# Altium schematic sheet KeyPad.SchDoc
size A; SheetNumber: 9; SheetTotal: 12
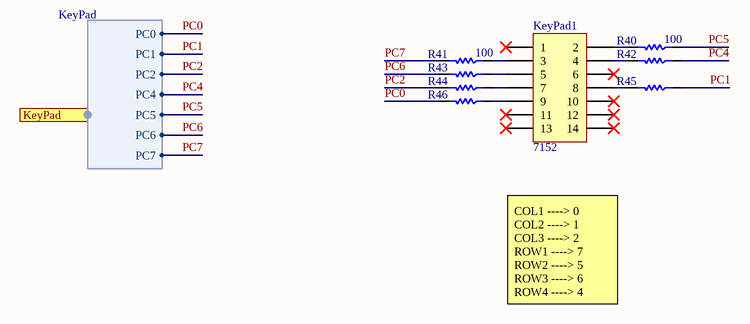
[diagram p0: KeyPad.SchDoc]

## Parts
KeyPad1  Inflow: 7152  [HDR_THT_7x2M_2.54mm]  (hidden comment: 7x2)
R40  100  [RES 1206 (3216X08L)]
R41  100  [RES 1206 (3216X08L)]
R42  (no value)  [RES 1206 (3216X08L)]
R43  (no value)  [RES 1206 (3216X08L)]
R44  (no value)  [RES 1206 (3216X08L)]
R45  (no value)  [RES 1206 (3216X08L)]
R46  (no value)  [RES 1206 (3216X08L)]

## Ports
KeyPad (harness KeyPad)

## Harnesses
KeyPad: PC0, PC1, PC2, PC4, PC5, PC6, PC7

## Nets
PC0: R46.2 ; port KeyPad.PC0
PC1: R45.1 ; port KeyPad.PC1
PC2: R44.2 ; port KeyPad.PC2
PC4: R42.1 ; port KeyPad.PC4
PC5: R40.1 ; port KeyPad.PC5
PC6: R43.2 ; port KeyPad.PC6
PC7: R41.2 ; port KeyPad.PC7
NetKeyPad1_2: KeyPad1.2 R40.2
NetKeyPad1_3: KeyPad1.3 R41.1
NetKeyPad1_4: KeyPad1.4 R42.2
NetKeyPad1_5: KeyPad1.5 R43.1
NetKeyPad1_7: KeyPad1.7 R44.1
NetKeyPad1_8: KeyPad1.8 R45.2
NetKeyPad1_9: KeyPad1.9 R46.1

Not connected (* = marked no-connect by the designer): KeyPad1 1* 6* 10* 11* 12* 13* 14*

## Notes on the sheet
- COL1 ----> 0
  COL2 ----> 1
  COL3 ----> 2
  ROW1 ----> 7
  ROW2 ----> 5
  ROW3 ----> 6
  ROW4 ----> 4

## Library data of the parts
KeyPad1 = Con_MPH_7x2_V_THT_2.54: Header, dual row, 14 pin; Rating: Rating?; Validation: NT; Value: 7x2; Package: Package?; Type: Type?
R40-R46 = Res_SMD_1206: Resistor; Inflow: inflow?; Rating: 0.25W; Validation: Valid; Package: 1206; Type: 10%
  R40 R41: Value: 100